# Altium project Servo-Board-v1.0.PrjPcb (part 18 of 23)

## Sheet Sec_Controller_Sheet2.SchDoc
size 420 x 297 mm; SheetNumber: 13; SheetTotal: 26
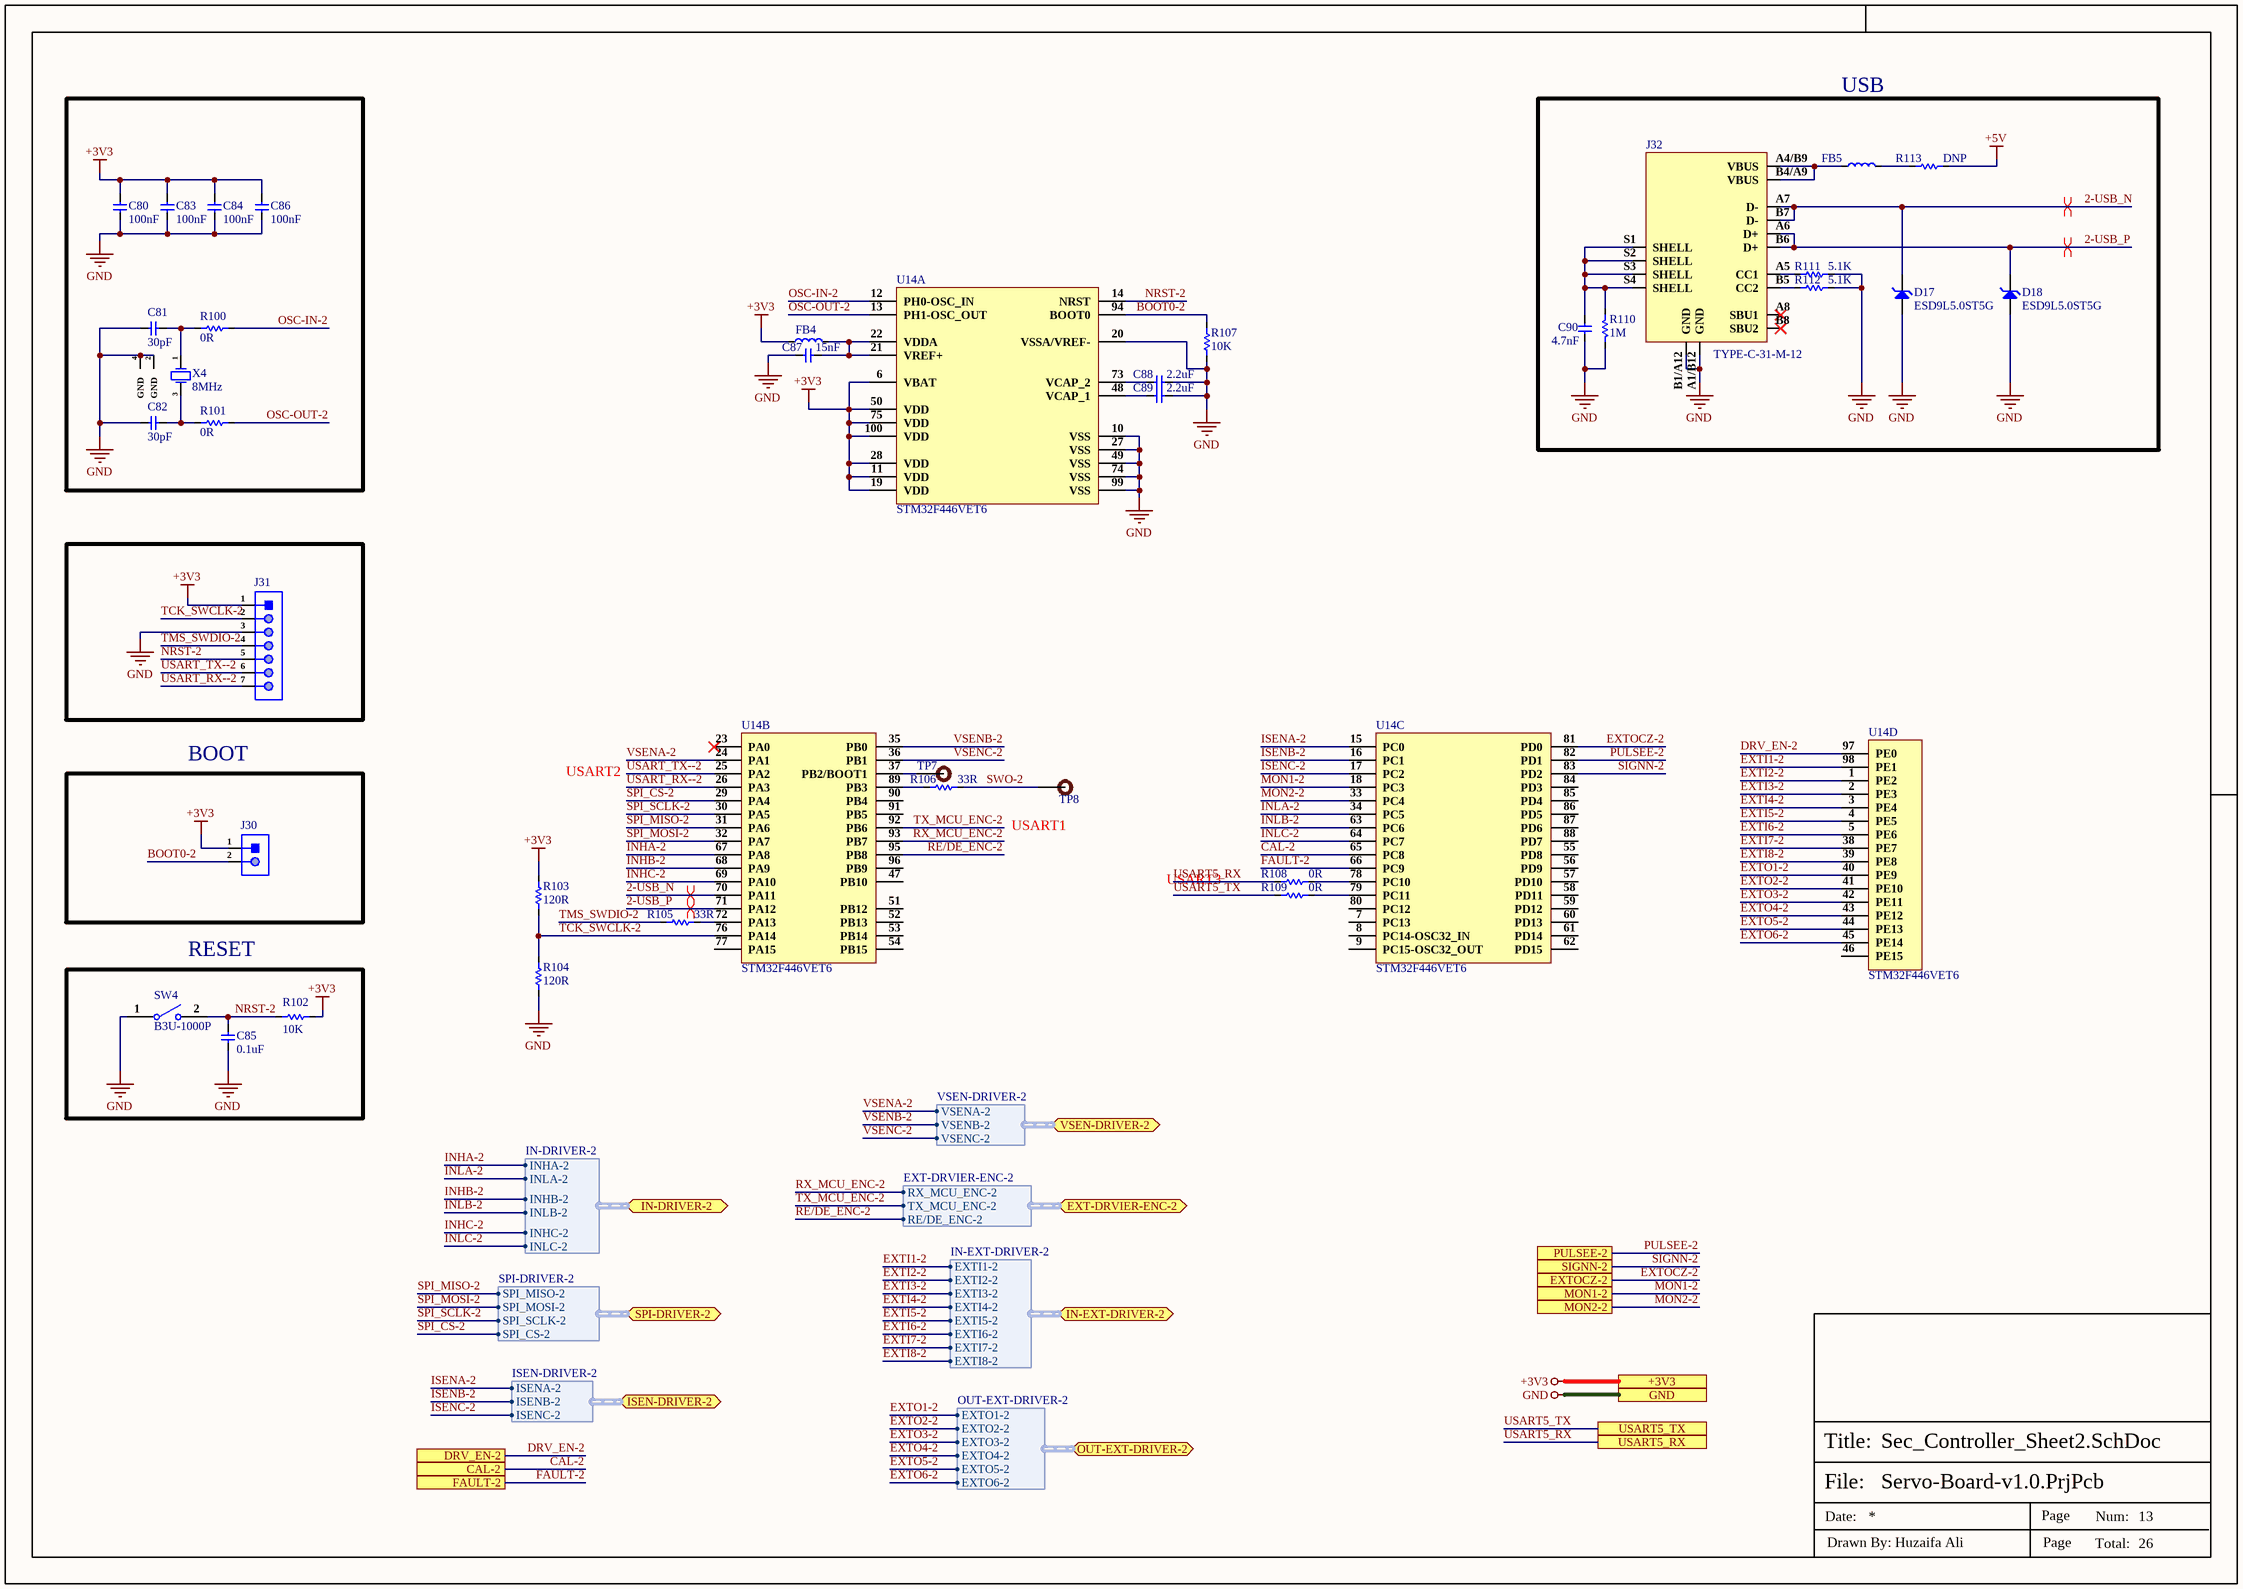
[diagram p22: Sec_Controller_Sheet2.SchDoc]

### Parts
C80  100nF  [cap-0402]
C81  30pF  [Cap-0402]
C82  30pF  [Cap-0402]
C83  100nF  [cap-0402]
C84  100nF  [cap-0402]
C85  0.1uF  [Cap-0402]
C86  100nF  [cap-0402]
C87  15nF  [Cap-0402]
C88  2.2uF  [Cap-0402]
C89  2.2uF  [Cap-0402]
C90  4.7nF  [Cap-0603]
D17  ESD9L5.0ST5G  [SOD-923.]
D18  ESD9L5.0ST5G  [SOD-923.]
FB4  BLM18PG221SN1D  [IND-0603 (1608 Metric)]  (value not drawn)
FB5  BLM18PG221SN1D  [IND-0603 (1608 Metric)]  (value not drawn)
J30  X6511WV-02H-C60D30  [HDR1X2_]  (value not drawn)
J31  X6511WV-07H-C60D30  [HDR1X7]  (value not drawn)
J32  TYPE-C-31-M-12  [TYPE-C-31-M-12_]
R100  0R  [Res-0603]
R101  0R  [Res-0603]
R102  10K  [Res-0402]
R103  120R  [Res-0402]
R104  120R  [Res-0402]
R105  33R  [Res-0402]
R106  33R  [Res-0402]
R107  10K  [Res-0402]
R108  0R  [Res-0402]
R109  0R  [Res-0402]
R110  1M  [Res-0402]
R111  5.1K  [Res-0402]
R112  5.1K  [Res-0402]
R113  DNP  [Res-0402]
SW4  B3U-1000P  [B3U-1000P]
TP7  TEST POINT 0.5mm Dia  [Test-point - 0.5mm]  (value not drawn)  (no BOM)
TP8  TEST POINT 0.5mm Dia  [Test-point - 0.5mm]  (value not drawn)  (no BOM)
U14  STM32F446VET6  [LQFP-100]  (parts A,B,C,D of 4)
X4  8MHz  [5TJ480000XYLBC_]

### Blocks framed on the sheet
USB: C90 D17 D18 FB5 J32 R110-R113
BOOT: J30
RESET: C85 R102 SW4

### Ports
+3V3 (see Servo2[3A], CAN_Sheet[4D], Controller_Sheet[5D], DIO_1[5D], DIO_2[5D], DIO_3[5D], DIO_4[5D], Encoder_Sheet1[5D], Encoder_Sheet2[4D], Encoder_Sheet3[4D], Encoder_Sheet4[5D], EtherCAT_Sheet[5D], Motor_Driver_Sheet1[5D], Motor_Driver_Sheet2[5D], Motor_Driver_Sheet3[5D], Motor_Driver_Sheet4[5D], Power_Sheet[5D], RS485_RS232_Sheet[5D], Sec_Controller_Sheet1[5D], Sec_Controller_Sheet3[5D], Sec_Controller_Sheet4[5D], Servo1[5D], Servo2[5D], Servo3[5D], Servo4[5D]), CAL-2 (see Servo2[3A], Motor_Driver_Sheet2[1D]), DRV_EN-2 (see Servo2[3A], Motor_Driver_Sheet2[1D]), EXT-DRVIER-ENC-2 (bidir, harness EXT-DRVIER-ENC-2, see Servo2[4B], Encoder_Sheet2[3D]), EXTOCZ-2 (see Servo2[4B], DIO_2[3D]), FAULT-2 (see Servo2[3B], Motor_Driver_Sheet2[1D]), GND (see Servo2[3A], CAN_Sheet[4D], Controller_Sheet[5D], DIO_1[5D], DIO_2[5D], DIO_3[5D], DIO_4[5D], Encoder_Sheet1[5D], Encoder_Sheet2[4D], Encoder_Sheet3[4D], Encoder_Sheet4[5D], EtherCAT_Sheet[5D], Motor_Driver_Sheet1[5D], Motor_Driver_Sheet2[5D], Motor_Driver_Sheet3[5D], Motor_Driver_Sheet4[5D], Power_Sheet[5D], RS485_RS232_Sheet[5D], Sec_Controller_Sheet1[5D], Sec_Controller_Sheet3[5D], Sec_Controller_Sheet4[5D], Servo1[5D], Servo2[5D], Servo3[5D], Servo4[5D]), IN-DRIVER-2 (bidir, harness IN-DRIVER-2, see Servo2[3B], Motor_Driver_Sheet2[1D]), IN-EXT-DRIVER-2 (bidir, harness IN-EXT-DRIVER-2, see Servo2[4B], DIO_2[1D]), ISEN-DRIVER-2 (bidir, harness ISEN-DRIVER-2, see Servo2[3B], Motor_Driver_Sheet2[3D]), MON1-2 (see Servo2[4B], DIO_2[3D]), MON2-2 (see Servo2[4B], DIO_2[3D]), OUT-EXT-DRIVER-2 (bidir, harness OUT-EXT-DRIVER-2, see Servo2[4B], DIO_2[2D]), PULSEE-2 (see Servo2[4B], DIO_2[3D]), SIGNN-2 (see Servo2[4B], DIO_2[3D]), SPI-DRIVER-2 (bidir, harness SPI-DRIVER-2, see Servo2[3B], Motor_Driver_Sheet2[2D]), USART5_RX (see Servo2[3B], Controller_Sheet[4D], Servo2[3B]), USART5_TX (see Servo2[3B], Controller_Sheet[4D], Servo2[3B]), VSEN-DRIVER-2 (bidir, harness VSEN-DRIVER-2, see Servo2[3B], Motor_Driver_Sheet2[4D])

### Harnesses
IN-DRIVER-2: INHA-2, INLA-2, INHB-2, INLB-2, INHC-2, INLC-2
SPI-DRIVER-2: SPI_MISO-2, SPI_MOSI-2, SPI_SCLK-2, SPI_CS-2
ISEN-DRIVER-2: ISENA-2, ISENB-2, ISENC-2
EXT-DRVIER-ENC-2: RX_MCU_ENC-2, TX_MCU_ENC-2, RE/DE_ENC-2
IN-EXT-DRIVER-2: EXTI1-2, EXTI2-2, EXTI3-2, EXTI4-2, EXTI5-2, EXTI6-2, EXTI7-2, EXTI8-2
OUT-EXT-DRIVER-2: EXTO1-2, EXTO2-2, EXTO3-2, EXTO4-2, EXTO5-2, EXTO6-2
VSEN-DRIVER-2: VSENA-2, VSENB-2, VSENC-2

### Nets
+3V3: C80.2 C83.2 C84.2 C86.2 FB4.1 J30.1 J31.1 R102.2 R103.2 U14.6(VBAT) U14.11(VDD) U14.19(VDD) U14.28(VDD) U14.50(VDD) U14.75(VDD) U14.100(VDD) ; port +3V3
+5V: R113.2
GND: C80.1 C81.1 C82.1 C83.1 C84.1 C85.1 C86.1 C87.1 C88.2 C89.2 C90.1 D17.2(A) D18.2(A) J31.3 J32.A1/B12(GND) J32.B1/A12(GND) R104.1 R107.1 R110.2 R111.2 R112.2 SW4.1 U14.10(VSS) U14.20(VSSA/VREF-) U14.27(VSS) U14.49(VSS) U14.74(VSS) U14.99(VSS) X4.2(GND) X4.4(GND) ; port GND
2-USB_N: D17.1(K) J32.A7(D-) J32.B7(D-) U14.70(PA11)
2-USB_P: D18.1(K) J32.A6(D+) J32.B6(D+) U14.71(PA12)
BOOT0-2: J30.2 R107.2 U14.94(BOOT0)
CAL-2: U14.65(PC8) ; port CAL-2
DRV_EN-2: U14.97(PE0) ; port DRV_EN-2
EXTI1-2: U14.98(PE1) ; port IN-EXT-DRIVER-2.EXTI1-2
EXTI2-2: U14.1(PE2) ; port IN-EXT-DRIVER-2.EXTI2-2
EXTI3-2: U14.2(PE3) ; port IN-EXT-DRIVER-2.EXTI3-2
EXTI4-2: U14.3(PE4) ; port IN-EXT-DRIVER-2.EXTI4-2
EXTI5-2: U14.4(PE5) ; port IN-EXT-DRIVER-2.EXTI5-2
EXTI6-2: U14.5(PE6) ; port IN-EXT-DRIVER-2.EXTI6-2
EXTI7-2: U14.38(PE7) ; port IN-EXT-DRIVER-2.EXTI7-2
EXTI8-2: U14.39(PE8) ; port IN-EXT-DRIVER-2.EXTI8-2
EXTO1-2: U14.40(PE9) ; port OUT-EXT-DRIVER-2.EXTO1-2
EXTO2-2: U14.41(PE10) ; port OUT-EXT-DRIVER-2.EXTO2-2
EXTO3-2: U14.42(PE11) ; port OUT-EXT-DRIVER-2.EXTO3-2
EXTO4-2: U14.43(PE12) ; port OUT-EXT-DRIVER-2.EXTO4-2
EXTO5-2: U14.44(PE13) ; port OUT-EXT-DRIVER-2.EXTO5-2
EXTO6-2: U14.45(PE14) ; port OUT-EXT-DRIVER-2.EXTO6-2
EXTOCZ-2: U14.81(PD0) ; port EXTOCZ-2
FAULT-2: U14.66(PC9) ; port FAULT-2
INHA-2: U14.67(PA8) ; port IN-DRIVER-2.INHA-2
INHB-2: U14.68(PA9) ; port IN-DRIVER-2.INHB-2
INHC-2: U14.69(PA10) ; port IN-DRIVER-2.INHC-2
INLA-2: U14.34(PC5) ; port IN-DRIVER-2.INLA-2
INLB-2: U14.63(PC6) ; port IN-DRIVER-2.INLB-2
INLC-2: U14.64(PC7) ; port IN-DRIVER-2.INLC-2
ISENA-2: U14.15(PC0) ; port ISEN-DRIVER-2.ISENA-2
ISENB-2: U14.16(PC1) ; port ISEN-DRIVER-2.ISENB-2
ISENC-2: U14.17(PC2) ; port ISEN-DRIVER-2.ISENC-2
MON1-2: U14.18(PC3) ; port MON1-2
MON2-2: U14.33(PC4) ; port MON2-2
NRST-2: C85.2 J31.5 R102.1 SW4.2 U14.14(NRST)
OSC-IN-2: R100.2 U14.12(PH0-OSC_IN)
OSC-OUT-2: R101.2 U14.13(PH1-OSC_OUT)
PULSEE-2: U14.82(PD1) ; port PULSEE-2
RE/DE_ENC-2: U14.95(PB8) ; port EXT-DRVIER-ENC-2.RE/DE_ENC-2
RX_MCU_ENC-2: U14.93(PB7) ; port EXT-DRVIER-ENC-2.RX_MCU_ENC-2
SIGNN-2: U14.83(PD2) ; port SIGNN-2
SPI_CS-2: U14.29(PA4) ; port SPI-DRIVER-2.SPI_CS-2
SPI_MISO-2: U14.31(PA6) ; port SPI-DRIVER-2.SPI_MISO-2
SPI_MOSI-2: U14.32(PA7) ; port SPI-DRIVER-2.SPI_MOSI-2
SPI_SCLK-2: U14.30(PA5) ; port SPI-DRIVER-2.SPI_SCLK-2
SWO-2: R106.2 TP8.1
TCK_SWCLK-2: J31.2 R103.1 R104.2 U14.76(PA14)
TMS_SWDIO-2: J31.4 R105.1
TX_MCU_ENC-2: U14.92(PB6) ; port EXT-DRVIER-ENC-2.TX_MCU_ENC-2
USART5_RX: R108.1 ; port USART5_RX
USART5_TX: R109.1 ; port USART5_TX
USART_RX--2: J31.7 U14.26(PA3)
USART_TX--2: J31.6 U14.25(PA2)
VSENA-2: U14.24(PA1) ; port VSEN-DRIVER-2.VSENA-2
VSENB-2: U14.35(PB0) ; port VSEN-DRIVER-2.VSENB-2
VSENC-2: U14.36(PB1) ; port VSEN-DRIVER-2.VSENC-2
NetC81_2: C81.2 R100.1 X4.1(OSC1)
NetC82_2: C82.2 R101.1 X4.3(OSC2)
NetC87_2: C87.2 FB4.2 U14.21(VREF+) U14.22(VDDA)
NetC88_1: C88.1 U14.73(VCAP_2)
NetC89_1: C89.1 U14.48(VCAP_1)
NetC90_2: C90.2 J32.S1(SHELL) J32.S2(SHELL) J32.S3(SHELL) J32.S4(SHELL) R110.1
NetFB5_1: FB5.1 J32.A4/B9(VBUS) J32.B4/A9(VBUS)
NetFB5_2: FB5.2 R113.1
NetJ32_A5: J32.A5(CC1) R111.1
NetJ32_B5: J32.B5(CC2) R112.1
NetR105_2: R105.2 U14.72(PA13)
NetR106_1: R106.1 U14.89(PB3)
NetR108_2: R108.2 U14.78(PC10)
NetR109_2: R109.2 U14.79(PC11)
NetTP7_1: TP7.1 U14.37(PB2/BOOT1)

Not connected (* = marked no-connect by the designer): J32 A8(SBU1)* B8(SBU2)*; U14 7(PC13) 8(PC14-OSC32_IN) 9(PC15-OSC32_OUT) 23(PA0)* 46(PE15) 47(PB10) 51(PB12) 52(PB13) 53(PB14) 54(PB15) 55(PD8) 56(PD9) 57(PD10) 58(PD11) 59(PD12) 60(PD13) 61(PD14) 62(PD15) 77(PA15) 80(PC12) 84(PD3) 85(PD4) 86(PD5) 87(PD6) 88(PD7) 90(PB4) 91(PB5) 96(PB9)

### Layout directives
differential pair; net class USB_PROGRAM; differential pair class USB_PROGRAM_LINES; rule Impedance Constraint [Min = 85.00    Max = 90.00    ]; rule Matched Net Lengths [Tolerance = 50mil]: 2-USB_N, 2-USB_P

### Notes on the sheet
- USART2
- (near TP8) USART1
- USART3
- File:
- Title:
- Date:
- Page
- Num:
- Total:
- Drawn By: Huzaifa Ali

### Library data of the parts
C80 C83 C84 C86 = C1005X7R1H104KT000F: CAP CER 0.1UF 50V X7R 0402; Manufacturer: TDK; Tolerance: 10%; Voltage: 25V; Item Type: Capacitor; Supplier 1: Avnet; Manufacturer Part Number: C1005X7R1H104KT000F; RoHS: No; Category: Ceramic Capacitors; Dielectric: X7R; Supplier Part Number 1: C1005X7R1H104KT000F; LCSC Part Number: C361198; ComponentLink1Description: LCSC; ComponentLink1URL: https://www.lcsc.com/product-detail/Multilayer-Ceramic-Capacitors-MLCC-SMD-SMT_TDK-C1005X7R1H104KT000F_C361198.html
C81 C82 = CC0402GRNPO9BN300: CAP CER 30PF 50V C0G/NPO 0402; Manufacturer: Yageo; Item Type: Capacitor; Tolerance: 2%; Dielectric: C0G; Supplier: Digikey; LCSC Part Number: C277479; Manufacturer Part Number: CC0402GRNPO9BN300; RoHS: Yes; Stock: 114930; Pricing: 1=0.1, 10=0.052, 50=0.0296, 100=0.023, 500=0.01728, 1000=0.01358, 2500=0.01235, 5000=0.01136 (USD); Mounting Technology: Surface Mount; Case/Package: 0402; Case Code (Imperial): 0402; Case Code (Metric): 1005; Weight: 2.3E-05oz; Min Operating Temperature: -55°C; Max Operating Temperature: 125°C; Value: 30pF; Voltage Rating (DC): 50V; Packaging: Tape and Reel; Termination: SMD/SMT; Voltage Rating: 50V; Series: CC; Length: 0.039inch; Width: 0.02inch; Thickness: 0.022inch; Halogen Free: 5694HalogenFree; Lead Free: 5697LeadFree; ComponentLink1URL: https://datasheet.ciiva.com/13263/upy-gp-np0-16v-to-50v-8-3714-13263350.pdf?src-supplier=Mouser; ComponentLink1Description: https://datasheet.ciiva.com/13263/upy-gp-np0-16v-to-50v-8-3714-13263350.pdf?src-supplier=Mouser
C85 = CC0402JRX7R7BB104: CAP CER 0.1UF 16V X7R 0402; Manufacturer: Yageo; Material: 4241ConductorMaterial; Value: 100nF; Tolerance: 5%; Item Type: Capacitor; Supplier: Digikey; Supplier Part Number: 311-1676-1-ND; Manufacturer Part Number: CC0402JRX7R7BB104; RoHS: Yes; Category: Ceramic Capacitors; Stock: 1659111; Pricing: 1=0.1, 10=0.046, 50=0.0262, 100=0.0203, 500=0.01528, 1000=0.012, 2500=0.01091, 5000=0.01004 (USD); Mounting Technology: Surface Mount; Case/Package: 0402; Case Code (Metric): 1005; Case Code (Imperial): 0402; Min Operating Temperature: -55°C; Max Operating Temperature: 125°C; Dielectric: X7R; Packaging: Tape and Reel; Package Quantity: 10000; Voltage Rating (DC): 16V; Voltage Rating: 16V; Series: CC; Construction: Flat; Length: 0.039inch; Width: 0.02inch; Height: 0.5mm; Thickness: 0.022inch; Lead Free: Lead Free; Halogen Free: Halogen Free; RoHS Compliant: Yes; ComponentLink1URL: https://datasheet.ciiva.com/13210/upy-gphc-x7r-6-3v-to-50v-8-12304-13210152.pdf?src-supplier=Mouser; ComponentLink1Description: https://datasheet.ciiva.com/13210/upy-gphc-x7r-6-3v-to-50v-8-12304-13210152.pdf?src-supplier=Mouser; LCSC Part Number: C541464
C87 = CC0402JRX7R7BB153: CAP CER 0.015UF 16V X7R 0402; Manufacturer: Yageo; Tolerance: 5%; Item Type: Capacitor; Supplier: Digikey; Supplier Part Number: 13-CC0402JRX7R7BB153CT-ND; Manufacturer Part Number: CC0402JRX7R7BB153; RoHS: Yes; Category: Ceramic Capacitors; Stock: 24539; Pricing: 1=0.1, 10=0.045, 50=0.0258, 100=0.0201, 500=0.0151, 1000=0.01186, 2500=0.01078, 5000=0.00992 (USD); Mounting Technology: Surface Mount; Case/Package: 0402; Case Code (Imperial): 0402; Case Code (Metric): 1005; Weight: 2.3E-05oz; Min Operating Temperature: -55°C; Max Operating Temperature: 125°C; Value: 15nF; Voltage Rating (DC): 16V; Packaging: Tape and Reel; Dielectric: X7R; Voltage Rating: 16V; Termination: SMD/SMT; Series: CC; Length: 0.039inch; Width: 0.02inch; Thickness: 0.022inch; Lead Free: Lead Free; Halogen Free: Halogen Free; RoHS Compliant: Yes; ComponentLink1URL: https://datasheet.ciiva.com/13263/upy-gphc-x7r-6-3v-to-50v-8-12304-13263342.pdf?src-supplier=Mouser; ComponentLink1Description: https://datasheet.ciiva.com/13263/upy-gphc-x7r-6-3v-to-50v-8-12304-13263342.pdf?src-supplier=Mouser; LCSC Part Number: C527002
C88 C89 = C1005X5R0J225KTJA0E: CAP CER 2.2UF 6.3V X5R 0402; Manufacturer: TDK; Item Type: Capacitor; LCSC Part Number: C343036; Manufacturer Part Number: C1005X5R0J225KTJA0E; ComponentLink1Description: LCSC; ComponentLink1URL: https://www.lcsc.com/product-detail/Multilayer-Ceramic-Capacitors-MLCC-SMD-SMT_TDK-C1005X5R0J225KTJA0E_C343036.html
C90 = CC0603JRNPO9BN472: CAP CER 4700PF 50V C0G/NPO 0603; Manufacturer: Yageo; Item Type: Capacitor; Supplier 1: Digi-Key; Manufacturer Part Number: CC0603JRNPO9BN472; RoHS: Yes; Category: Ceramic Capacitors; Stock 1: 31779; Pricing 1: 1=0.48000, 10=0.33000, 50=0.23100, 100=0.19800, 500=0.14854, 1000=0.12543 (USD); RoHS Compliant: Yes; Supplier Part Number 1: 13-CC0603JRNPO9BN472CT-ND; LCSC Part Number: C576818; ComponentLink1Description: LCSC; ComponentLink1URL: https://www.lcsc.com/product-detail/Multilayer-Ceramic-Capacitors-MLCC-SMD-SMT_YAGEO-CC0603JRNPO9BN472_C576818.html
D17 D18 = ESD9L5.0ST5G: TVS DIODE 5V 9.8V SOD923; Manufacturer: ON Semiconductor; Capacitance: 0.9pF; Direction: Unidirectional; Number of Unidirectional Channels: 1; Min Breakdown Voltage: 5.4V; Power Line Protection: No; Leakage Current: 1uA; Element Configuration: Single; Peak Pulse Current: 1A; Diode Type: ZENER; Reverse Breakdown Voltage: 5.8V; Peak Pulse Power: 150mW; ESD Protection: Yes; Test Current: 1mA; Supplier 1: Digi-Key; Manufacturer Part Number: ESD9L5.0ST5G; RoHS: Yes; Category: ESD and Circuit Protection ICs; Stock 1: 558996; Pricing 1: 1=0.37000, 10=0.25600, 100=0.12500, 500=0.10426, 1000=0.07244, 2000=0.06278 (USD); Case/Package: SOD-923-2; Number of Pins: 2; Contact Plating: Tin,Matte; Min Operating Temperature: -55°C; Max Operating Temperature: 150°C; Package Quantity: 1; Packaging: Tape and Reel; Clamping Voltage: 9.8V; Reverse Standoff Voltage: 5V; Working Voltage: 5V; Resistor Type: Zener; Series: Automotive, AEC-Q101; Number of Elements: 1; Operating Supply Voltage: 5V; Max Surge Current: 1A; Breakdown Voltage: 5.4V; Number of Channels: 1; Polarity: Unidirectional; Termination: SMD/SMT; Max Reverse Leakage Current: 1uA; Max Breakdown Voltage: 5.4V; Number of Lines: 1; Power Dissipation: 150mW; Clamping Voltage-Max: 9.8V; Length: 0.8mm; Width: 0.65mm; Height: 0.4mm; Depth: 0.6mm; Radiation Hardening: No; Lead Free: Lead Free; RoHS Compliant: Yes; REACH SVHC: No SVHC; Halogen Free: Halogen Free; ComponentLink1URL: https://datasheet.ciiva.com/15143/getdatasheetpartid-185186-15143896.pdf?src-supplier=Verical; ComponentLink1Description: https://datasheet.ciiva.com/15143/getdatasheetpartid-185186-15143896.pdf?src-supplier=Verical; ComponentLink2URL: https://datasheet.ciiva.com/4510/esd9l-d-4510647.pdf?src-supplier=Mouser; ComponentLink2Description: https://datasheet.ciiva.com/4510/esd9l-d-4510647.pdf?src-supplier=Mouser; ComponentLink3URL: https://datasheet.ciiva.com/3304/esd9l-d-3304011.pdf?src-supplier=Avnet; ComponentLink3Description: https://datasheet.ciiva.com/3304/esd9l-d-3304011.pdf?src-supplier=Avnet; ComponentLink4URL: https://datasheet.ciiva.com/16437/esd9l-d-16437835.pdf?src-supplier=Future+Electronics; ComponentLink4Description: https://datasheet.ciiva.com/16437/esd9l-d-16437835.pdf?src-supplier=Future+Electronics; ComponentLink5URL: https://datasheet.ciiva.com/339/esd9l-d-339853.pdf?src-supplier=Digi-Key; ComponentLink5Description: https://datasheet.ciiva.com/339/esd9l-d-339853.pdf?src-supplier=Digi-Key; ComponentLink6URL: https://datasheet.ciiva.com/339/esd9l-d-339854.pdf?src-supplier=Digi-Key; ComponentLink6Description: https://datasheet.ciiva.com/339/esd9l-d-339854.pdf?src-supplier=Digi-Key; ComponentLink7URL: https://datasheet.ciiva.com/11195/esd9l-d-11195342.pdf?src-supplier=Avnet; ComponentLink7Description: https://datasheet.ciiva.com/11195/esd9l-d-11195342.pdf?src-supplier=Avnet; ComponentLink8URL: https://datasheet.ciiva.com/25958/esd9l-d-25958446.pdf?src-supplier=Avnet+Europe; ComponentLink8Description: https://datasheet.ciiva.com/25958/esd9l-d-25958446.pdf?src-supplier=Avnet+Europe; ComponentLink9URL: https://datasheet.ciiva.com/339/esd9l-d-339855.pdf?src-supplier=Digi-Key; ComponentLink9Description: https://datasheet.ciiva.com/339/esd9l-d-339855.pdf?src-supplier=Digi-Key; Supplier Part Number 1: ESD9L5.0ST5GOSCT-ND; LCSC Part Number: C82326
FB4 FB5 = BLM18PG221SN1D: FERRITE BEAD 220 OHM 0603 1LN; Manufacturer: Murata; Manufacturer Series: BLM18P; Material: Steel,Ferrite; Value: 100mR; Impedance: 220R; Tolerance: 25%; Current Rating: 1.4A; Number of Lines: 1; Test Frequency: 100MHz; Shielding: Unshielded; Supplier: Digikey; LCSC Part Number: C80165; Manufacturer Part Number: BLM18PG221SN1D; RoHS: Yes; Item Type: Ferrite Bead; Stock: 134052; Pricing: 1=0.1, 10=0.078, 25=0.0712, 50=0.064, 100=0.0469, 250=0.03412, 500=0.03128, 1000=0.02701 (USD); Case/Package: 0603; Pins: 2; Core Material: Ferrite; Case Code (Metric): 1608; Case Code (Imperial): 0603; Weight: 7.1E-05oz; Min Operating Temperature: -55°C; Max Operating Temperature: 125°C; Package Quantity: 1; Packaging: Tape and Reel; ESR (Equivalent Series Resistance): 220R; Max Current Rating: 1.4A; DC Resistance (DCR): 100mR; Termination: SMD/SMT; Max DC Current: 1.4A; DC Current: 1.4A; Number of Circuits: 1; Series: BLM18P; Channels: 1; DC Resistance-Max: 100mR; RMS Current (Irms): 1.4A; ESR: 100mR; Length: 1.6mm; Width: 0.8mm; Height: 0.8mm; Depth: 0.8mm; Radiation Hardening: No; Reach SVHC Compliant: No; Lead Free: Lead Free; RoHS Compliant: Yes; ComponentLink1URL: https://datasheet.ciiva.com/19458/1845030-19458417.pdf?src-supplier=Jameco; ComponentLink1Description: https://datasheet.ciiva.com/19458/1845030-19458417.pdf?src-supplier=Jameco; ComponentLink2URL: https://datasheet.ciiva.com/11800/0900766b81275ca5-11800851.pdf?src-supplier=Rs; ComponentLink2Description: https://datasheet.ciiva.com/11800/0900766b81275ca5-11800851.pdf?src-supplier=Rs; ComponentLink3URL: https://datasheet.ciiva.com/29347/442391-da-01-en-chip-drossel-0603-220r-1400ma-1-6x0-8mm-29347986.pdf?src-supplier=Conrad; ComponentLink3Description: https://datasheet.ciiva.com/29347/442391-da-01-en-chip-drossel-0603-220r-1400ma-1-6x0-8mm-29347986.pdf?src-supplier=Conrad; ComponentLink4URL: https://datasheet.ciiva.com/8021/5148-8021482.pdf?src-supplier=Element14; ComponentLink4Description: https://datasheet.ciiva.com/8021/5148-8021482.pdf?src-supplier=Element14; ComponentLink5URL: https://datasheet.ciiva.com/8021/5148-8021479.pdf?src-supplier=Element14; ComponentLink5Description: https://datasheet.ciiva.com/8021/5148-8021479.pdf?src-supplier=Element14; ComponentLink6URL: https://datasheet.ciiva.com/14122/blm-series-eng-tds-14122909.pdf?src-supplier=Distrelec; ComponentLink6Description: https://datasheet.ciiva.com/14122/blm-series-eng-tds-14122909.pdf?src-supplier=Distrelec; ComponentLink7URL: https://datasheet.ciiva.com/1012/l0110s0100blm18p-1012162.pdf?src-supplier=Digikey; ComponentLink7Description: https://datasheet.ciiva.com/1012/l0110s0100blm18p-1012162.pdf?src-supplier=Digikey; ComponentLink8URL: https://datasheet.ciiva.com/1012/l0110s0100blm18p-1012161.pdf?src-supplier=Digikey; ComponentLink8Description: https://datasheet.ciiva.com/1012/l0110s0100blm18p-1012161.pdf?src-supplier=Digikey; ComponentLink9URL: https://datasheet.ciiva.com/1012/l0110s0100blm18p-1012163.pdf?src-supplier=Digikey; ComponentLink9Description: https://datasheet.ciiva.com/1012/l0110s0100blm18p-1012163.pdf?src-supplier=Digikey; ComponentLink10URL: https://datasheet.ciiva.com/3081/l0110s0100blm18p-3081633.pdf?src-supplier=Avnet; ComponentLink10Description: https://datasheet.ciiva.com/3081/l0110s0100blm18p-3081633.pdf?src-supplier=Avnet; ComponentLink11URL: https://datasheet.ciiva.com/16205/l0110s0100blm18p-16205422.pdf?src-supplier=Future+Electronics; ComponentLink11Description: https://datasheet.ciiva.com/16205/l0110s0100blm18p-16205422.pdf?src-supplier=Future+Electronics
J30 = X6511WV-02H-C60D30: Gold 250V 3A Straight Square Pins 2.5mm 2P 260℃ 6mm -40℃~+105℃ 3mm 2.54mm Plugin Black Brass 1x2P Plugin,P=2.54mm Pin Headers ROHS; Manufacturer: XKB; Item Type: Male Header; Manufacturer Part Number: X6511WV-02H-C60D30; Package: Plugin,P=2.54mm; LCSC Part Number: C706874; ComponentLink1Description: LCSC; ComponentLink1URL: https://www.lcsc.com/product-detail/Pin-Headers_XKB-Connectivity-X6511WV-02H-C60D30_C706874.html
J31 = X6511WV-07H-C60D30: Gold 250V 3A Straight Square Pins 2.5mm 7P 260℃ 6mm -40℃~+105℃ 3mm 2.54mm Plugin Black Brass 1x7P Plugin,P=2.54mm Pin Headers ROHS; Manufacturer: XKB; Item Type: Male Header; Manufacturer Part Number: X6511WV-07H-C60D30; Package: Plugin,P=2.54mm; LCSC Part Number: C706879; ComponentLink1Description: LCSC; ComponentLink1URL: https://www.lcsc.com/product-detail/Pin-Headers_XKB-Connectivity-X6511WV-07H-C60D30_C706879.html
J32 = TYPE-C-31-M-12: 5A 1 16P Female Type-C SMD USB Connectors ROHS; Manufacturer: Korean Hroparts Elec; ComponentLink1Description: LCSC; ComponentLink1URL: https://www.lcsc.com/product-detail/USB-Connectors_Korean-Hroparts-Elec-TYPE-C-31-M-12_C165948.html; Manufacturer Part Number: TYPE-C-31-M-12; Footprint: Custom; LCSC Part Number: C165948; Item Type: USB Connector
R100 R101 = RC0603JR-070RL: RES 0 OHM JUMPER 1/10W 0603; Manufacturer: Yageo; Resistance: 0mR; Tolerance: 1%; Power Rating: 100mW; Voltage Rating (DC): 50V; Temperature Coefficient: 200ppm/°C; Resistance Tolerance: 5%; Item Type: Resistor; Supplier 1: Digi-Key; Manufacturer Part Number: RC0603JR-070RL; RoHS: Yes; Category: Chip SMD Resistors; Stock 1: 18081776; Pricing 1: 1=0.10000, 10=0.01700, 25=0.01240, 50=0.00960, 100=0.00700, 250=0.00536, 500=0.00430, 1000=0.00316 (USD); Case/Package: 0603; Number of Pins: 2; Contact Plating: Tin,Matte; Case Code (Imperial): 0603; Case Code (Metric): 1608; Size Code: 0603; Min Operating Temperature: -55°C; Max Operating Temperature: 155°C; Resistor Type: Thick Film; Packaging: Tape and Reel; Termination: SMD/SMT; Series: RC; Technology: THICK FILM; Package Quantity: 5000; Voltage Rating: 50V; Features: Moisture Resistant; Max Power Dissipation: 100mW; Number of Terminations: 2; Construction: Rectangular; Length: 1.6mm; Width: 0.8mm; Height: 0.45mm; Depth: 0.8mm; Radiation Hardening: No; Reach SVHC Compliant: No SVHC; Lead Free: Lead Free; RoHS Compliant: Yes; Military Standard: Not; Supplier Part Number 1: 311-0.0GRCT-ND; LCSC Part Number: C95177
R102 R107 = RC0402FR-0710KL: RES 10K OHM 1% 1/16W 0402; Manufacturer: Yageo; Resistance: 10kR; Voltage Rating (DC): 50V; Temperature Coefficient: 100ppm/°C; Power Rating: 62.5mW; Max Power Dissipation: 63mW; Item Type: Resistor; Supplier 1: Mouser; Manufacturer Part Number: RC0402FR-0710KL; RoHS: Yes; Category: Chip SMD Resistors; Stock 1: 18648329; Pricing 1: 1=0.10000, 10=0.01400, 50=0.01400, 100=0.00500, 1000=0.00300, 10000=0.00200 (USD); Case/Package: 0402; Number of Pins: 2; Case Code (Imperial): 0402; Case Code (Metric): 1005; Min Operating Temperature: -55°C; Max Operating Temperature: 155°C; Resistor Type: Thick Film; Tolerance: 1%; Packaging: Tape and Reel; Voltage Rating: 50V; Termination: SMD/SMT; Working Voltage: 50V; Number of Terminations: 2; Features: Moisture Resistant; Series: RC; Resistance Tolerance: 1%; Construction: Rectangular; Length: 1mm; Width: 0.5mm; Height: 0.32mm; Depth: 0.5mm; Lead Pitch: 0.2mm; REACH SVHC: No SVHC; Lead Free: Lead Free; RoHS Compliant: Yes; Military Standard: Not; ComponentLink1URL: https://datasheet.ciiva.com/7660/38568-7660787.pdf?src-supplier=Element14; ComponentLink1Description: https://datasheet.ciiva.com/7660/38568-7660787.pdf?src-supplier=Element14; ComponentLink2URL: https://datasheet.ciiva.com/7849/1686128-7849814.pdf?src-supplier=Element14; ComponentLink2Description: https://datasheet.ciiva.com/7849/1686128-7849814.pdf?src-supplier=Element14; ComponentLink3URL: https://datasheet.ciiva.com/7983/1018594-7983486.pdf?src-supplier=Element14; ComponentLink3Description: https://datasheet.ciiva.com/7983/1018594-7983486.pdf?src-supplier=Element14; ComponentLink4URL: https://datasheet.ciiva.com/22747/1018594-22747512.pdf?src-supplier=Element14; ComponentLink4Description: https://datasheet.ciiva.com/22747/1018594-22747512.pdf?src-supplier=Element14; ComponentLink5URL: https://datasheet.ciiva.com/12667/pyu-rc0402-51-rohs-l-6-r-12667067.pdf?src-supplier=Mouser; ComponentLink5Description: https://datasheet.ciiva.com/12667/pyu-rc0402-51-rohs-l-6-r-12667067.pdf?src-supplier=Mouser; ComponentLink6URL: https://datasheet.ciiva.com/7849/1784430-7849813.pdf?src-supplier=Element14; ComponentLink6Description: https://datasheet.ciiva.com/7849/1784430-7849813.pdf?src-supplier=Element14; ComponentLink7URL: https://datasheet.ciiva.com/7849/1784430-7849815.pdf?src-supplier=Element14; ComponentLink7Description: https://datasheet.ciiva.com/7849/1784430-7849815.pdf?src-supplier=Element14; Supplier Part Number 1: 603-RC0402FR-0710KL; LCSC Part Number: C60490
R103 R104 = RC0402FR-07120RL: RES 120 OHM 1% 1/16W 0402; Manufacturer: Yageo; Item Type: Resistors; Power Rating: 62.5mW; Voltage Rating: 50V; Temperature Coefficient: 100ppm/°C; Max Power Dissipation: 63mW; Supplier: Future Electronics; Supplier Part Number: 4529079; Manufacturer Part Number: RC0402FR-07120RL; RoHS: Yes; Stock: 150000; Pricing: 10000=0.0012, 100000=0.0011, 300000=0.001, 750000=0.001, 2000000=0.0009 (USD); Case/Package: 0402; Case Code (Imperial): 0402; Case Code (Metric): 1005; Min Operating Temperature: -55°C; Max Operating Temperature: 155°C; Package Quantity: 1; Value: 120R; Tolerance: 1%; Packaging: Tape and Reel; Termination: SMD/SMT; Resistor Type: Thick Film; Number of Terminations: 2; Features: Moisture Resistant; Series: RC; Resistance Tolerance: 1%; Construction: Rectangular; Technology: THICK FILM; Voltage Rating (AC): 50V; Length: 0.039inch; Width: 0.02inch; Height: 0.016inch; Depth: 0.5mm; Reach SVHC Compliant: No; Military Standard: Not; RoHS Compliant: Yes; Lead Free: 5697LeadFree; ComponentLink1URL: https://datasheet.ciiva.com/12667/pyu-rc0402-51-rohs-l-6-r-12667958.pdf?src-supplier=Mouser; ComponentLink1Description: https://datasheet.ciiva.com/12667/pyu-rc0402-51-rohs-l-6-r-12667958.pdf?src-supplier=Mouser; ComponentLink2URL: https://datasheet.ciiva.com/7849/1018594-7849831.pdf?src-supplier=Element14; ComponentLink2Description: https://datasheet.ciiva.com/7849/1018594-7849831.pdf?src-supplier=Element14; LCSC Part Number: C114758
R105 R106 = RC0402FR-0733RL: RES 33 OHM 1% 1/16W 0402; Manufacturer: Yageo; Power Rating: 62.5mW; Voltage Rating: 50V; Temperature Coefficient: 100ppm/°C; Max Power Dissipation: 63mW; Supplier 1: Mouser; Manufacturer Part Number: RC0402FR-0733RL; RoHS: Yes; Category: Chip SMD Resistors; Stock 1: 1843488; Pricing 1: 1=0.10000, 10=0.01200, 50=0.01200, 100=0.00500, 1000=0.00300, 10000=0.00100 (USD); Case/Package: 0402; Number of Pins: 2; Case Code (Imperial): 0402; Case Code (Metric): 1005; Size Code: 0402; Min Operating Temperature: -55°C; Max Operating Temperature: 155°C; Resistor Type: Thick Film; Resistance: 33R; Tolerance: 1%; Packaging: Tape and Reel; Voltage Rating (DC): 50V; Package Quantity: 10000; Termination: SMD/SMT; Features: Moisture Resistant; Series: RC; Number of Terminations: 2; Resistance Tolerance: 1%; Construction: Rectangular; Technology: THICK FILM; Length: 1mm; Width: 0.5mm; Height: 0.35mm; Depth: 0.5mm; RoHS Compliant: Yes; REACH SVHC: Unknown; Military Standard: Not; Lead Free: Lead Free; ComponentLink1URL: https://datasheet.ciiva.com/11819/0900766b80c66297-11819487.pdf?src-supplier=RSComponents; ComponentLink1Description: https://datasheet.ciiva.com/11819/0900766b80c66297-11819487.pdf?src-supplier=RSComponents; ComponentLink2URL: https://datasheet.ciiva.com/24070/pyu-rc0402-51-rohs-l-6-r-8721-24070077.pdf?src-supplier=Mouser; ComponentLink2Description: https://datasheet.ciiva.com/24070/pyu-rc0402-51-rohs-l-6-r-8721-24070077.pdf?src-supplier=Mouser; ComponentLink3URL: https://datasheet.ciiva.com/7849/1018594-7849967.pdf?src-supplier=Element14; ComponentLink3Description: https://datasheet.ciiva.com/7849/1018594-7849967.pdf?src-supplier=Element14; ComponentLink4URL: https://datasheet.ciiva.com/7849/1018594-7849966.pdf?src-supplier=Element14; ComponentLink4Description: https://datasheet.ciiva.com/7849/1018594-7849966.pdf?src-supplier=Element14; ComponentLink5URL: https://datasheet.ciiva.com/15189/getdatasheetpartid-329253-15189431.pdf?src-supplier=Verical; ComponentLink5Description: https://datasheet.ciiva.com/15189/getdatasheetpartid-329253-15189431.pdf?src-supplier=Verical; ComponentLink6URL: https://datasheet.ciiva.com/17070/pyu-rc0402-51-rohs-l-6-r-17070335.pdf?src-supplier=Future+Electronics; ComponentLink6Description: https://datasheet.ciiva.com/17070/pyu-rc0402-51-rohs-l-6-r-17070335.pdf?src-supplier=Future+Electronics; Supplier Part Number 1: 603-RC0402FR-0733RL; LCSC Part Number: C138002
R108 R109 = RC0402FR-070RL: RES 0 OHM JUMPER 1/16W 0402; Manufacturer: Yageo; Item Type: Resistors; Tolerance: 1%; Power Rating: 62.5mW; Voltage Rating: 50V; Temperature Coefficient: 200ppm/°C; Max Power Dissipation: 63mW; Supplier 1: Mouser; Manufacturer Part Number: RC0402FR-070RL; RoHS: Yes; Stock 1: 8556842; Pricing 1: 1=0.10000, 10=0.01400, 50=0.01400, 100=0.00600, 1000=0.00300, 5000=0.00200, 10000=0.00100 (USD); Mount: Surface Mount; Case/Package: 0402; Contact Plating: Tin,Matte; Case Code (Imperial): 0402; Case Code (Metric): 1005; Size Code: 0402; Min Operating Temperature: -55°C; Max Operating Temperature: 155°C; Resistance: 0R; Resistor Type: Thick Film; Packaging: Tape and Reel; Termination: SMD/SMT; Features: Moisture Resistant; Series: RC; Number of Terminations: 2; Length: 1mm; Width: 0.5mm; Height: 0.35mm; Radiation Hardening: No; Lead Free: Lead Free; RoHS Compliant: Yes; ComponentLink1URL: https://datasheet.ciiva.com/8896/pyu-rc0402-51-rohs-l-6-8896149.pdf?src-supplier=Avnet; ComponentLink1Description: https://datasheet.ciiva.com/8896/pyu-rc0402-51-rohs-l-6-8896149.pdf?src-supplier=Avnet; ComponentLink2URL: https://datasheet.ciiva.com/16790/pyu-rc0402-51-rohs-l-6-r-16790444.pdf?src-supplier=Future+Electronics; ComponentLink2Description: https://datasheet.ciiva.com/16790/pyu-rc0402-51-rohs-l-6-r-16790444.pdf?src-supplier=Future+Electronics; Supplier Part Number 1: 603-RC0402FR-070RL; LCSC Part Number: C106231
R110 = AF0402JR-071ML: RES SMD 1M OHM 5% 1/16W 0402; Manufacturer: Yageo; Resistance: 1MR; Max Power Dissipation: 63mW; Temperature Coefficient: 100ppm/°C; Item Type: Resistor; Supplier 1: Digi-Key; Manufacturer Part Number: AF0402JR-071ML; Stock 1: 0; Pricing 1: 10000=0.00408 (USD); Case/Package: 0402; Min Operating Temperature: -55°C; Max Operating Temperature: 155°C; Packaging: Tape and Reel; Resistor Type: Thick Film; Number of Terminations: 2; Tolerance: 5%; Features: Moisture Resistant,Anti-Sulfur; Length: 0.039inch; Width: 0.02inch; Height: 0.015inch; RoHS Compliant: Yes; ComponentLink1URL: https://www.yageo.com/upload/media/product/productsearch/datasheet/rchip/PYu-AF_51_RoHS_L_6.pdf?src-supplier=Digi-Key; ComponentLink1Description: https://www.yageo.com/upload/media/product/productsearch/datasheet/rchip/PYu-AF_51_RoHS_L_6.pdf?src-supplier=Digi-Key; Supplier Part Number 1: AF0402JR-071ML-ND; LCSC Part Number: C144054
R111 R112 = RC0402FR-075K1L: RES 5.1K OHM 1% 1/16W 0402; Manufacturer: Yageo; Power Rating: 63mW; Resistance: 5.1kR; Temperature Coefficient: 100ppm/°C; Voltage Rating: 50V; Item Type: Resistor; Supplier 1: Avnet; Manufacturer Part Number: RC0402FR-075K1L; RoHS: Yes; Category: Chip SMD Resistors; Stock 1: 65000; Pricing 1: 10000=0.00085 (USD); Case/Package: 0402; Case Code (Metric): 1005; Case Code (Imperial): 0402; Min Operating Temperature: -55°C; Max Operating Temperature: 155°C; Tolerance: 1%; Technology: THICK FILM; Packaging: Tape and Reel; Package Quantity: 1; Resistor Type: Thick Film; Number of Terminations: 2; Termination: SMD/SMT; Max Power Dissipation: 63mW; Voltage Rating (DC): 50V; Working Voltage: 50V; Features: Moisture Resistant; Series: RC; Resistance Tolerance: 1%; Construction: Rectangular; Length: 1mm; Width: 0.02inch; Height: 0.016inch; Depth: 0.5mm; RoHS Compliant: Yes; Military Standard: Not; Lead Free: Lead Free; ComponentLink1URL: https://datasheet.ciiva.com/7983/1018594-7983519.pdf?src-supplier=Element14; ComponentLink1Description: https://datasheet.ciiva.com/7983/1018594-7983519.pdf?src-supplier=Element14; ComponentLink2URL: https://datasheet.ciiva.com/46394/1018594-46394936.pdf?src-supplier=Element14; ComponentLink2Description: https://datasheet.ciiva.com/46394/1018594-46394936.pdf?src-supplier=Element14; ComponentLink3URL: https://datasheet.ciiva.com/2453/pyu-r-int-thick-7-2453401.pdf?src-supplier=Digi-Key; ComponentLink3Description: https://datasheet.ciiva.com/2453/pyu-r-int-thick-7-2453401.pdf?src-supplier=Digi-Key; ComponentLink4URL: https://datasheet.ciiva.com/2453/pyu-r-int-thick-7-2453402.pdf?src-supplier=Digi-Key; ComponentLink4Description: https://datasheet.ciiva.com/2453/pyu-r-int-thick-7-2453402.pdf?src-supplier=Digi-Key; ComponentLink5URL: https://datasheet.ciiva.com/2453/pyu-r-int-thick-7-2453400.pdf?src-supplier=Digi-Key; ComponentLink5Description: https://datasheet.ciiva.com/2453/pyu-r-int-thick-7-2453400.pdf?src-supplier=Digi-Key; ComponentLink6URL: https://datasheet.ciiva.com/12558/pyu-rc0402-51-rohs-l-6-r-8721-12558460.pdf?src-supplier=Mouser; ComponentLink6Description: https://datasheet.ciiva.com/12558/pyu-rc0402-51-rohs-l-6-r-8721-12558460.pdf?src-supplier=Mouser; ComponentLink7URL: https://datasheet.ciiva.com/16744/pyu-rc0402-51-rohs-l-6-r-16744283.pdf?src-supplier=Future+Electronics; ComponentLink7Description: https://datasheet.ciiva.com/16744/pyu-rc0402-51-rohs-l-6-r-16744283.pdf?src-supplier=Future+Electronics; ComponentLink8URL: https://datasheet.ciiva.com/15189/getdatasheetpartid-323636-15189493.pdf?src-supplier=Verical; ComponentLink8Description: https://datasheet.ciiva.com/15189/getdatasheetpartid-323636-15189493.pdf?src-supplier=Verical; Supplier Part Number 1: RC0402FR-075K1L; LCSC Part Number: C105872
R113 = RC0402FR-070RL: RES 0 OHM JUMPER 1/16W 0402; Manufacturer: Yageo; Item Type: Resistors; Resistance: 0R; Tolerance: 1%; Power Rating: 62.5mW; Voltage Rating: 50V; Temperature Coefficient: 200ppm/°C; Max Power Dissipation: 63mW; Supplier 1: Mouser; Manufacturer Part Number: RC0402FR-070RL; RoHS: Yes; Stock 1: 8556842; Pricing 1: 1=0.10000, 10=0.01400, 50=0.01400, 100=0.00600, 1000=0.00300, 5000=0.00200, 10000=0.00100 (USD); Mount: Surface Mount; Case/Package: 0402; Contact Plating: Tin,Matte; Case Code (Imperial): 0402; Case Code (Metric): 1005; Size Code: 0402; Min Operating Temperature: -55°C; Max Operating Temperature: 155°C; Resistor Type: Thick Film; Packaging: Tape and Reel; Termination: SMD/SMT; Features: Moisture Resistant; Series: RC; Number of Terminations: 2; Length: 1mm; Width: 0.5mm; Height: 0.35mm; Radiation Hardening: No; Lead Free: Lead Free; RoHS Compliant: Yes; ComponentLink1URL: https://datasheet.ciiva.com/8896/pyu-rc0402-51-rohs-l-6-8896149.pdf?src-supplier=Avnet; ComponentLink1Description: https://datasheet.ciiva.com/8896/pyu-rc0402-51-rohs-l-6-8896149.pdf?src-supplier=Avnet; ComponentLink2URL: https://datasheet.ciiva.com/16790/pyu-rc0402-51-rohs-l-6-r-16790444.pdf?src-supplier=Future+Electronics; ComponentLink2Description: https://datasheet.ciiva.com/16790/pyu-rc0402-51-rohs-l-6-r-16790444.pdf?src-supplier=Future+Electronics; Supplier Part Number 1: 603-RC0402FR-070RL; LCSC Part Number: C106231
SW4 = B3U-1000P: SWITCH TACTILE SPST-NO 0.05A 12V; Manufacturer: Omron; Mechanical Life: 200000Cycles; Operating Force: 1.5N; Throw Configuration: SPST; Current Rating: 50mA; Contact Resistance: 100mR; Illumination Type: Non-Illuminated,Illuminated; Switch Travel: 0.15mm; Switch Function: Off-Mom; Actuator Type: Standard; Actuator Length: 0.4mm; Ratings: Dust Proof,IP40; ComponentLink1URL: http://www.farnell.com/datasheets/60838.pdf?src-supplier=Farnell; ComponentLink1Description: http://www.farnell.com/datasheets/60838.pdf?src-supplier=Farnell; ComponentLink2URL: http://www.farnell.com/datasheets/60838.pdf?src-supplier=Element14; ComponentLink2Description: http://www.farnell.com/datasheets/60838.pdf?src-supplier=Element14; ComponentLink3URL: https://omronfs.omron.com/en_US/ecb/products/pdf/en-b3u.pdf?src-supplier=Digi-Key; ComponentLink3Description: https://omronfs.omron.com/en_US/ecb/products/pdf/en-b3u.pdf?src-supplier=Digi-Key; ComponentLink4URL: http://www.omron.com/ecb/products/pdf/en-b3u.pdf?src-supplier=Digi-Key; ComponentLink4Description: http://www.omron.com/ecb/products/pdf/en-b3u.pdf?src-supplier=Digi-Key; ComponentLink5URL: https://www.distrelec.biz/Web/Downloads/he/et/B3U_eng_datasheet.pdf?mime=application%2Fpdf&src-supplier=Distrelec; ComponentLink5Description: https://www.distrelec.biz/Web/Downloads/he/et/B3U_eng_datasheet.pdf?mime=application%2Fpdf&src-supplier=Distrelec; ComponentLink6URL: http://www.onlinecomponents.com/productFiles/mf-OM/en-b3u.pdf?src-supplier=Onlinecomponents.com; ComponentLink6Description: http://www.onlinecomponents.com/productFiles/mf-OM/en-b3u.pdf?src-supplier=Onlinecomponents.com; Supplier 1: Digi-Key; Manufacturer Part Number: B3U-1000P; Stock 1: 116454; Pricing 1: 1=1, 10=0.961, 25=0.9064, 50=0.7976, 100=0.7251, 250=0.68888, 500=0.67074, 1000=0.52571 (USD); Mount: Surface Mount; Weight: 0.000776oz; Contact Material: Silver; Min Operating Temperature: -25°C; Max Operating Temperature: 70°C; Packaging: Tape and Reel; Voltage Rating (DC): 12V; Package Quantity: 1; Max Current Rating: 50mA; Termination: SMD/SMT; Orientation: Straight; Max Voltage Rating (DC): 12V; Electrical Life: 200000Cycles; Insulation Resistance: 100MR; Contact Current Rating: 50mA; Length: 4mm; Height: 1.2mm; Depth: 2.5mm; Width: 3mm; REACH SVHC: Unknown; Lead Free: Lead Free; ComponentLink7URL: https://www.verical.com/server-webapp/html/getDatasheet?partID=552554&src-supplier=Verical; ComponentLink7Description: https://www.verical.com/server-webapp/html/getDatasheet?partID=552554&src-supplier=Verical; ComponentLink8URL: http://www.farnell.com/datasheets/1685550.pdf?src-supplier=Element14; ComponentLink8Description: http://www.farnell.com/datasheets/1685550.pdf?src-supplier=Element14; ComponentLink9URL: http://www.farnell.com/datasheets/2610940.pdf?src-supplier=Farnell; ComponentLink9Description: http://www.farnell.com/datasheets/2610940.pdf?src-supplier=Farnell; ComponentLink10URL: https://www.alliedelec.com/m/d/4c8a9ef82804fc3c241a13c1e298fd73.pdf?src-supplier=Allied+Electronics; ComponentLink10Description: https://www.alliedelec.com/m/d/4c8a9ef82804fc3c241a13c1e298fd73.pdf?src-supplier=Allied+Electronics; Supplier Part Number 1: SW1020DKR-ND; LCSC Part Number: C231329; Item Type: Switch
TP7 TP8 = TEST POINT 0.5mm Dia: Test Point ON; Item Type: Test Point; Manufacturer Part Number: TEST POINT 0.5mm Dia
U14 = STM32F446VET6: IC MCU 32BIT 512KB FLASH 100LQFP; Manufacturer: STMicroelectronics; Manufacturer Part Number: STM32F446VET6; Package: LQFP (14x14); LCSC Part Number: C91929; Item Type: IC
X4 = 5TJ480000XYLBC: 8MHz 18pF ±10ppm SMD5032-4P Crystals ROHS; Manufacturer: JYJE; Manufacturer Part Number: 5TJ480000XYLBC; ComponentLink1Description: LCSC; ComponentLink1URL: https://www.lcsc.com/product-detail/Crystals_JYJE-5TJ480000XYLBC_C2149247.html; Package: SMD5032-4P; LCSC Part Number: C2149247; Item Type: Crystal

## Sheet Motor_Driver_Sheet2.SchDoc
size 420 x 297 mm; SheetNumber: 14; SheetTotal: 26
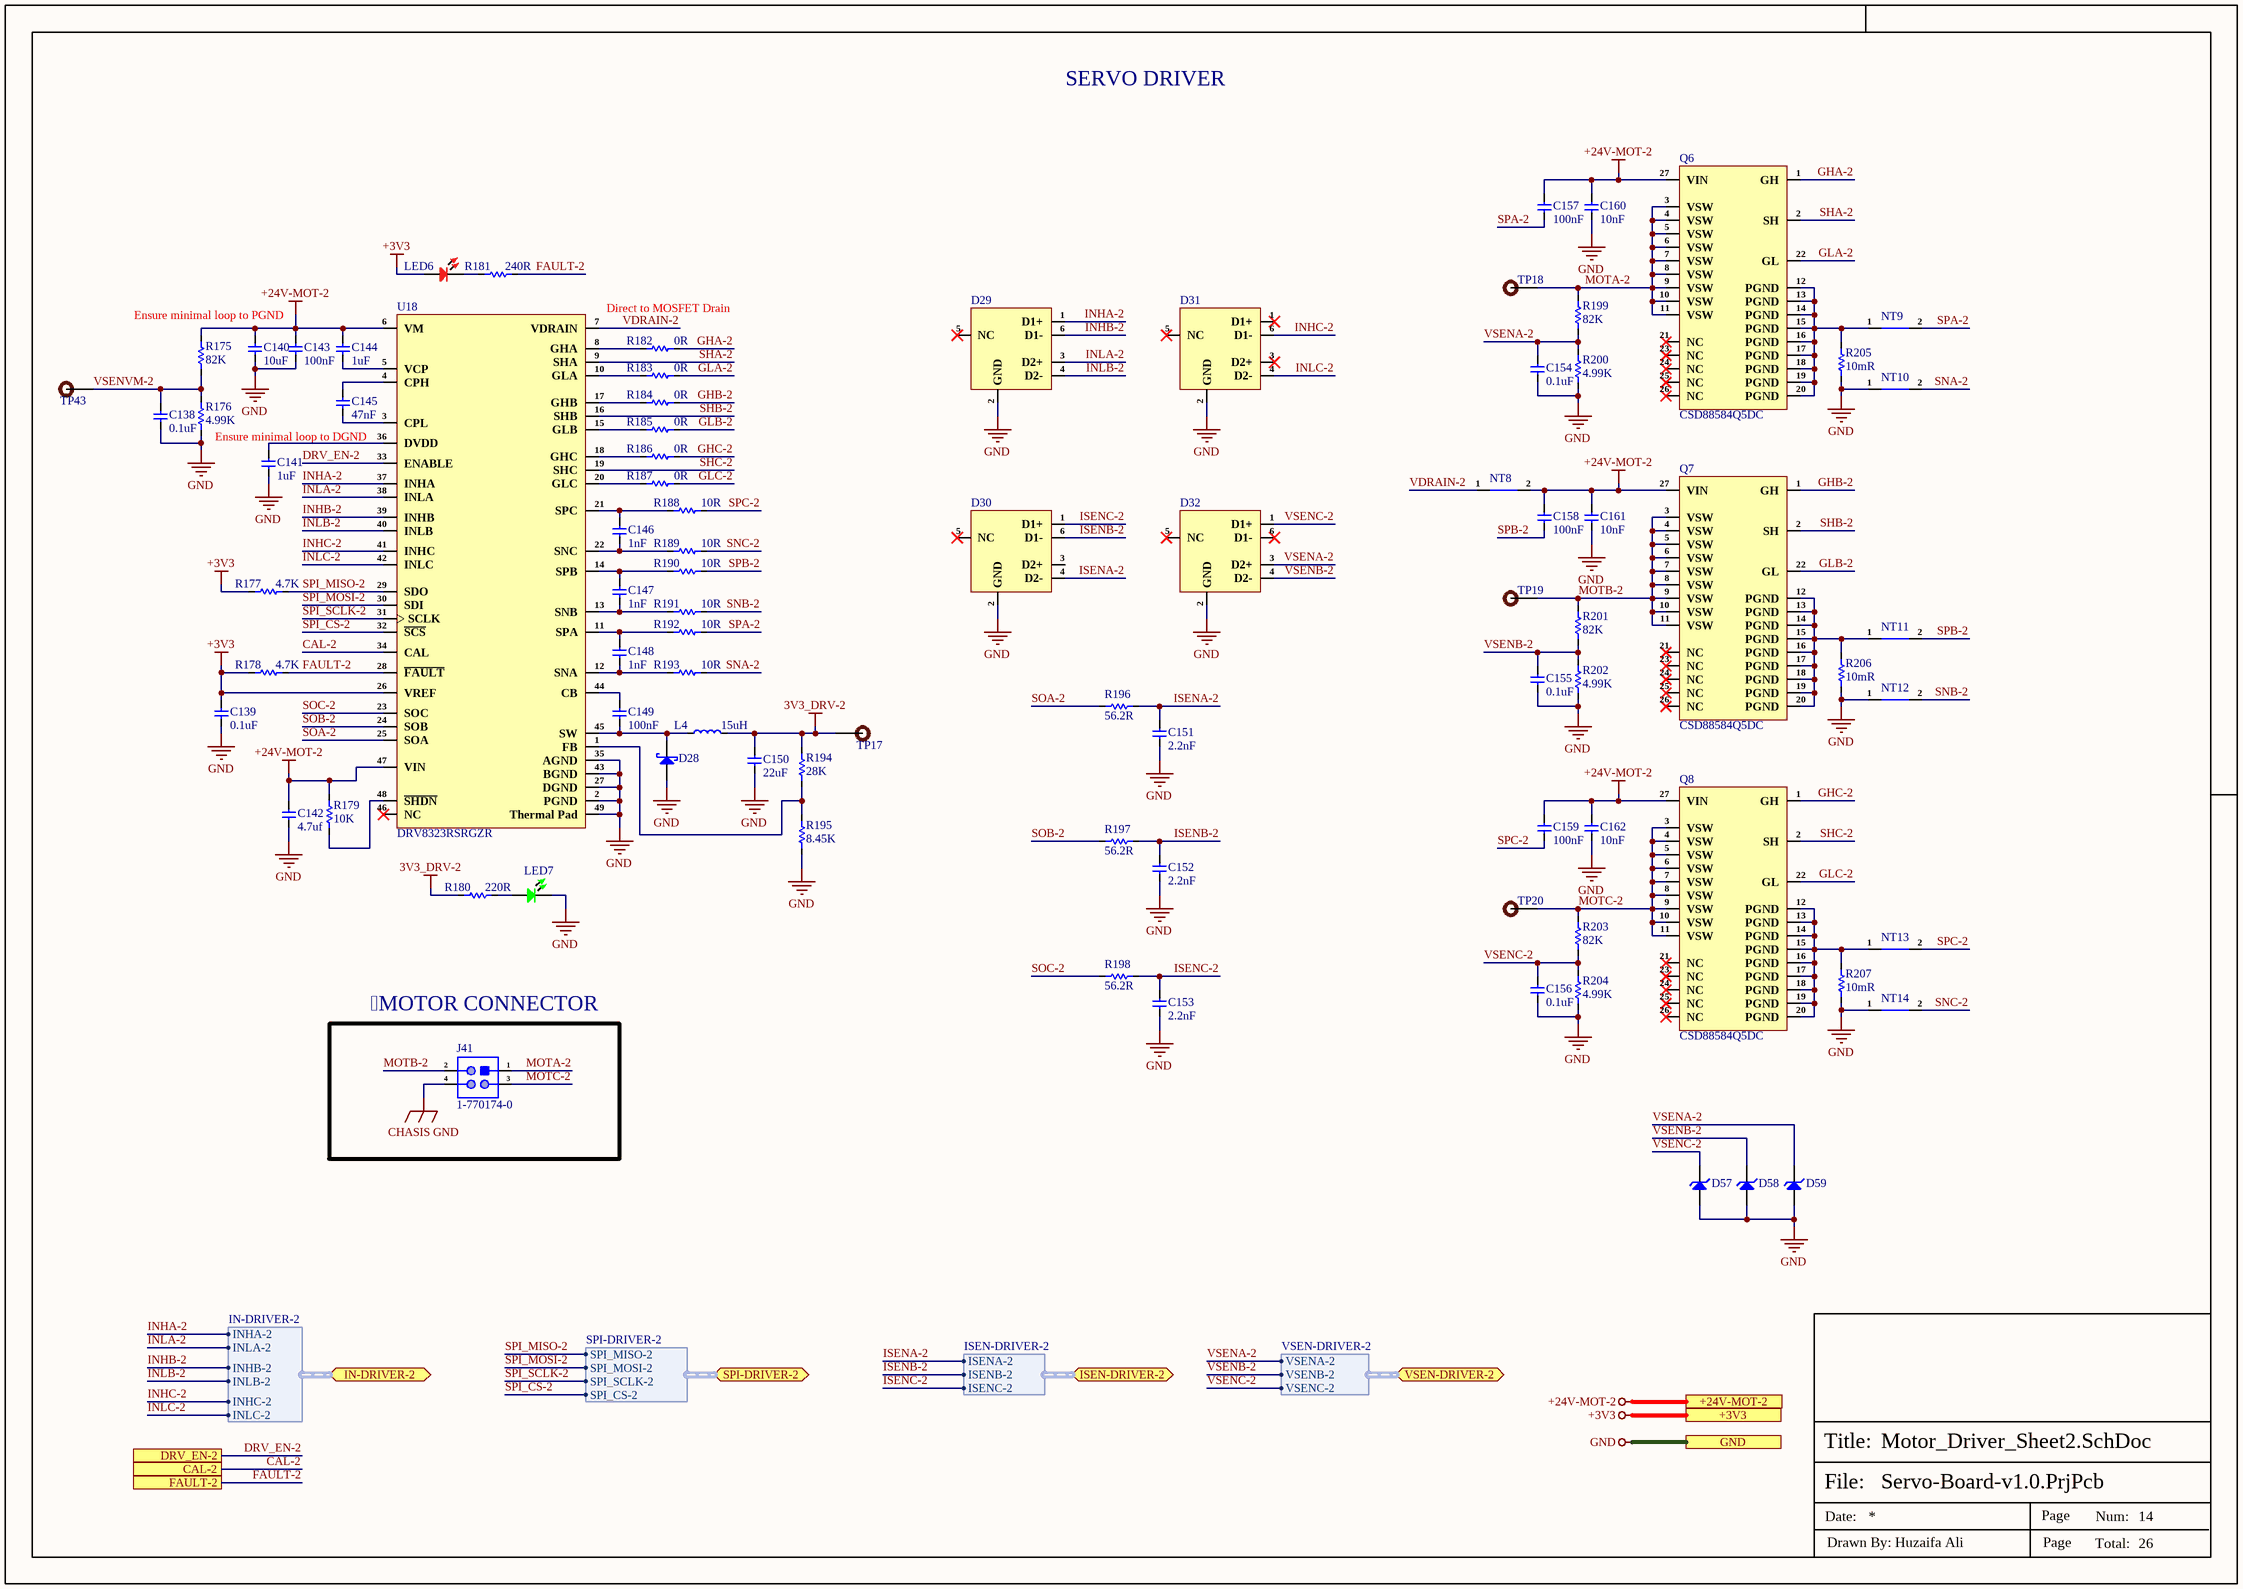
[diagram p23: Motor_Driver_Sheet2.SchDoc]

### Parts
C138  0.1uF  [Cap-0402]
C139  0.1uF  [Cap-0402]
C140  10uF  [Cap-1206]
C141  1uF  [Cap-0603]
C142  4.7uf  [Cap-0805]
C143  100nF  [Cap-0603]
C144  1uF  [Cap-0603]
C145  47nF  [Cap-0402]
C146  1nF  [Cap-0402]
C147  1nF  [Cap-0402]
C148  1nF  [Cap-0402]
C149  100nF  [Cap-0603]
C150  22uF  [Cap-0603]
C151  2.2nF  [Cap-0603]
C152  2.2nF  [Cap-0603]
C153  2.2nF  [Cap-0603]
C154  0.1uF  [Cap-0402]
C155  0.1uF  [Cap-0402]
C156  0.1uF  [Cap-0402]
C157  100nF  [Cap-0603]
C158  100nF  [Cap-0603]
C159  100nF  [Cap-0603]
C160  10nF  [Cap-0402]
C161  10nF  [Cap-0402]
C162  10nF  [Cap-0402]
D28  SS24A  [SMA]  (value not drawn)
D29  TPD4E1U06DCKR  [SOT-363]  (value not drawn)
D30  TPD4E1U06DCKR  [SOT-363]  (value not drawn)
D31  TPD4E1U06DCKR  [SOT-363]  (value not drawn)
D32  TPD4E1U06DCKR  [SOT-363]  (value not drawn)
D57  MM3Z3V3B  [SOD323F]  (value not drawn)
D58  MM3Z3V3B  [SOD323F]  (value not drawn)
D59  MM3Z3V3B  [SOD323F]  (value not drawn)
J41  1-770174-0  [1-770174-0]
L4  15uH  [FEXL0550A-150M]
LED6  RED  [LED-0603]  (value not drawn)
LED7  Emerald  [LED-0603]  (value not drawn)
NT8  Net Tie_SMD  [Net Tie Pad]  (value not drawn)  (net tie, no BOM)
NT9  Net Tie_SMD  [Net Tie Pad]  (value not drawn)  (net tie, no BOM)
NT10  Net Tie_SMD  [Net Tie Pad]  (value not drawn)  (net tie, no BOM)
NT11  Net Tie_SMD  [Net Tie Pad]  (value not drawn)  (net tie, no BOM)
NT12  Net Tie_SMD  [Net Tie Pad]  (value not drawn)  (net tie, no BOM)
NT13  Net Tie_SMD  [Net Tie Pad]  (value not drawn)  (net tie, no BOM)
NT14  Net Tie_SMD  [Net Tie Pad]  (value not drawn)  (net tie, no BOM)
Q6  CSD88584Q5DC  [22-VSON-CLIP (5x6)]
Q7  CSD88584Q5DC  [22-VSON-CLIP (5x6)]
Q8  CSD88584Q5DC  [22-VSON-CLIP (5x6)]
R175  82K  [Res-0603]
R176  4.99K  [Res-0603]
R177  4.7K  [Res-0402]
R178  4.7K  [Res-0402]
R179  10K  [Res-0402]
R180  220R  [Res-0603]
R181  240R  [Res-0402]
R182  0R  [Res-0402]
R183  0R  [Res-0402]
R184  0R  [Res-0402]
R185  0R  [Res-0402]
R186  0R  [Res-0402]
R187  0R  [Res-0402]
R188  10R  [Res-0603]
R189  10R  [Res-0603]
R190  10R  [Res-0603]
R191  10R  [Res-0603]
R192  10R  [Res-0603]
R193  10R  [Res-0603]
R194  28K  [Res-0402]
R195  8.45K  [Res-0402]
R196  56.2R  [Res-0603]
R197  56.2R  [Res-0603]
R198  56.2R  [Res-0603]
R199  82K  [Res-0603]
R200  4.99K  [Res-0603]
R201  82K  [Res-0603]
R202  4.99K  [Res-0603]
R203  82K  [Res-0603]
R204  4.99K  [Res-0603]
R205  10mR  [RES-2512]
R206  10mR  [RES-2512]
R207  10mR  [RES-2512]
TP17  TEST POINT 0.5mm Dia  [Test-point - 0.5mm]  (value not drawn)  (no BOM)
TP18  TEST POINT 0.5mm Dia  [Test-point - 0.5mm]  (value not drawn)  (no BOM)
TP19  TEST POINT 0.5mm Dia  [Test-point - 0.5mm]  (value not drawn)  (no BOM)
TP20  TEST POINT 0.5mm Dia  [Test-point - 0.5mm]  (value not drawn)  (no BOM)
TP43  TEST POINT 0.5mm Dia  [Test-point - 0.5mm]  (value not drawn)  (no BOM)
U18  DRV8323RSRGZR  [48-VQFN (7x7)]

### Ports
+3V3 (see Servo2[2A], CAN_Sheet[4D], Controller_Sheet[5D], DIO_1[5D], DIO_2[5D], DIO_3[5D], DIO_4[5D], Encoder_Sheet1[5D], Encoder_Sheet2[4D], Encoder_Sheet3[4D], Encoder_Sheet4[5D], EtherCAT_Sheet[5D], Motor_Driver_Sheet1[5D], Motor_Driver_Sheet3[5D], Motor_Driver_Sheet4[5D], Power_Sheet[5D], RS485_RS232_Sheet[5D], Sec_Controller_Sheet1[5D], Sec_Controller_Sheet2[5D], Sec_Controller_Sheet3[5D], Sec_Controller_Sheet4[5D], Servo1[5D], Servo2[5D], Servo3[5D], Servo4[5D]), +24V-MOT-2 (see Servo2[2A], Power_Sheet[5D], Servo2[5D]), CAL-2 (see Servo2[2A], Sec_Controller_Sheet2[2D]), DRV_EN-2 (see Servo2[2A], Sec_Controller_Sheet2[2D]), FAULT-2 (see Servo2[2B], Sec_Controller_Sheet2[2D]), GND (see Servo2[2A], CAN_Sheet[4D], Controller_Sheet[5D], DIO_1[5D], DIO_2[5D], DIO_3[5D], DIO_4[5D], Encoder_Sheet1[5D], Encoder_Sheet2[4D], Encoder_Sheet3[4D], Encoder_Sheet4[5D], EtherCAT_Sheet[5D], Motor_Driver_Sheet1[5D], Motor_Driver_Sheet3[5D], Motor_Driver_Sheet4[5D], Power_Sheet[5D], RS485_RS232_Sheet[5D], Sec_Controller_Sheet1[5D], Sec_Controller_Sheet2[5D], Sec_Controller_Sheet3[5D], Sec_Controller_Sheet4[5D], Servo1[5D], Servo2[5D], Servo3[5D], Servo4[5D]), IN-DRIVER-2 (bidir, harness IN-DRIVER-2, see Servo2[2B], Sec_Controller_Sheet2[2D]), ISEN-DRIVER-2 (bidir, harness ISEN-DRIVER-2, see Servo2[2B], Sec_Controller_Sheet2[2D]), SPI-DRIVER-2 (bidir, harness SPI-DRIVER-2, see Servo2[2B], Sec_Controller_Sheet2[2D]), VSEN-DRIVER-2 (bidir, harness VSEN-DRIVER-2, see Servo2[2B], Sec_Controller_Sheet2[3C])

### Harnesses
IN-DRIVER-2: INHA-2, INLA-2, INHB-2, INLB-2, INHC-2, INLC-2
SPI-DRIVER-2: SPI_MISO-2, SPI_MOSI-2, SPI_SCLK-2, SPI_CS-2
ISEN-DRIVER-2: ISENA-2, ISENB-2, ISENC-2
VSEN-DRIVER-2: VSENA-2, VSENB-2, VSENC-2

### Nets
3V3_DRV-2: C150.2 L4.2 R180.1 R194.2 TP17.1
+3V3: C139.2 LED6.1 R177.1 R178.1 U18.26(VREF) ; port +3V3
+24V-MOT-2: C140.2 C142.2 C143.2 C144.2 C157.2 C158.2 C159.2 C160.2 C161.2 C162.2 NT8.2 Q6.27(VIN) Q7.27(VIN) Q8.27(VIN) R175.2 R179.1 U18.6(VM) U18.47(VIN) ; port +24V-MOT-2
CHASIS GND: J41.4
GND: C138.1 C139.1 C140.1 C141.1 C142.1 C143.1 C150.1 C151.1 C152.1 C153.1 C154.1 C155.1 C156.1 C160.1 C161.1 C162.1 D28.2(A) D29.2(GND) D30.2(GND) D31.2(GND) D32.2(GND) D57.1(A) D58.1(A) D59.1(A) LED7.2 NT10.1 NT12.1 NT14.1 R176.1 R195.1 R200.1 R202.1 R204.1 R205.1 R206.1 R207.1 U18.2(PGND) U18.27(DGND) U18.35(AGND) U18.43(BGND) U18.49(Thermal_Pad) ; port GND
CAL-2: U18.34(CAL) ; port CAL-2
DRV_EN-2: U18.33(ENABLE) ; port DRV_EN-2
FAULT-2: R178.2 R181.2 U18.28(~{FAULT}) ; port FAULT-2
GHA-2: Q6.1(GH) R182.2
GHB-2: Q7.1(GH) R184.2
GHC-2: Q8.1(GH) R186.2
GLA-2: Q6.22(GL) R183.2
GLB-2: Q7.22(GL) R185.2
GLC-2: Q8.22(GL) R187.2
INHA-2: D29.1(D1+) U18.37(INHA) ; port IN-DRIVER-2.INHA-2
INHB-2: D29.6(D1-) U18.39(INHB) ; port IN-DRIVER-2.INHB-2
INHC-2: D31.6(D1-) U18.41(INHC) ; port IN-DRIVER-2.INHC-2
INLA-2: D29.3(D2+) U18.38(INLA) ; port IN-DRIVER-2.INLA-2
INLB-2: D29.4(D2-) U18.40(INLB) ; port IN-DRIVER-2.INLB-2
INLC-2: D31.4(D2-) U18.42(INLC) ; port IN-DRIVER-2.INLC-2
ISENA-2: C151.2 D30.4(D2-) R196.2 ; port ISEN-DRIVER-2.ISENA-2
ISENB-2: C152.2 D30.6(D1-) R197.2 ; port ISEN-DRIVER-2.ISENB-2
ISENC-2: C153.2 D30.1(D1+) R198.2 ; port ISEN-DRIVER-2.ISENC-2
MOTA-2: J41.1 Q6.3(VSW) Q6.4(VSW) Q6.5(VSW) Q6.6(VSW) Q6.7(VSW) Q6.8(VSW) Q6.9(VSW) Q6.10(VSW) Q6.11(VSW) R199.2 TP18.1
MOTB-2: J41.2 Q7.3(VSW) Q7.4(VSW) Q7.5(VSW) Q7.6(VSW) Q7.7(VSW) Q7.8(VSW) Q7.9(VSW) Q7.10(VSW) Q7.11(VSW) R201.2 TP19.1
MOTC-2: J41.3 Q8.3(VSW) Q8.4(VSW) Q8.5(VSW) Q8.6(VSW) Q8.7(VSW) Q8.8(VSW) Q8.9(VSW) Q8.10(VSW) Q8.11(VSW) R203.2 TP20.1
SHA-2: Q6.2(SH) U18.9(SHA)
SHB-2: Q7.2(SH) U18.16(SHB)
SHC-2: Q8.2(SH) U18.19(SHC)
SNA-2: NT10.2 R193.2
SNB-2: NT12.2 R191.2
SNC-2: NT14.2 R189.2
SOA-2: R196.1 U18.25(SOA)
SOB-2: R197.1 U18.24(SOB)
SOC-2: R198.1 U18.23(SOC)
SPA-2: C157.1 NT9.2 R192.2
SPB-2: C158.1 NT11.2 R190.2
SPC-2: C159.1 NT13.2 R188.2
SPI_CS-2: U18.32(~{SCS}) ; port SPI-DRIVER-2.SPI_CS-2
SPI_MISO-2: R177.2 U18.29(SDO) ; port SPI-DRIVER-2.SPI_MISO-2
SPI_MOSI-2: U18.30(SDI) ; port SPI-DRIVER-2.SPI_MOSI-2
SPI_SCLK-2: U18.31(SCLK) ; port SPI-DRIVER-2.SPI_SCLK-2
VDRAIN-2: NT8.1 U18.7(VDRAIN)
VSENA-2: C154.2 D32.3(D2+) D59.2(K) R199.1 R200.2 ; port VSEN-DRIVER-2.VSENA-2
VSENB-2: C155.2 D32.4(D2-) D58.2(K) R201.1 R202.2 ; port VSEN-DRIVER-2.VSENB-2
VSENC-2: C156.2 D32.1(D1+) D57.2(K) R203.1 R204.2 ; port VSEN-DRIVER-2.VSENC-2
VSENVM-2: C138.2 R175.1 R176.2 TP43.1
NetC141_2: C141.2 U18.36(DVDD)
NetC144_1: C144.1 U18.5(VCP)
NetC145_1: C145.1 U18.3(CPL)
NetC145_2: C145.2 U18.4(CPH)
NetC146_1: C146.1 R189.1 U18.22(SNC)
NetC146_2: C146.2 R188.1 U18.21(SPC)
NetC147_1: C147.1 R191.1 U18.13(SNB)
NetC147_2: C147.2 R190.1 U18.14(SPB)
NetC148_1: C148.1 R193.1 U18.12(SNA)
NetC148_2: C148.2 R192.1 U18.11(SPA)
NetC149_1: C149.1 D28.1(K) L4.1 U18.45(SW)
NetC149_2: C149.2 U18.44(CB)
NetLED6_2: LED6.2 R181.1
NetLED7_1: LED7.1 R180.2
NetNT9_1: NT9.1 Q6.12(PGND) Q6.13(PGND) Q6.14(PGND) Q6.15(PGND) Q6.16(PGND) Q6.17(PGND) Q6.18(PGND) Q6.19(PGND) Q6.20(PGND) R205.2
NetNT11_1: NT11.1 Q7.12(PGND) Q7.13(PGND) Q7.14(PGND) Q7.15(PGND) Q7.16(PGND) Q7.17(PGND) Q7.18(PGND) Q7.19(PGND) Q7.20(PGND) R206.2
NetNT13_1: NT13.1 Q8.12(PGND) Q8.13(PGND) Q8.14(PGND) Q8.15(PGND) Q8.16(PGND) Q8.17(PGND) Q8.18(PGND) Q8.19(PGND) Q8.20(PGND) R207.2
NetR179_2: R179.2 U18.48(~{SHDN})
NetR182_1: R182.1 U18.8(GHA)
NetR183_1: R183.1 U18.10(GLA)
NetR184_1: R184.1 U18.17(GHB)
NetR185_1: R185.1 U18.15(GLB)
NetR186_1: R186.1 U18.18(GHC)
NetR187_1: R187.1 U18.20(GLC)
NetR194_1: R194.1 R195.2 U18.1(FB)

Not connected (* = marked no-connect by the designer): D29 5(NC)*; D30 3(D2+) 5(NC)*; D31 1(D1+)* 3(D2+)* 5(NC)*; D32 5(NC)* 6(D1-)*; Q6 21(NC)* 23(NC)* 24(NC)* 25(NC)* 26(NC)*; Q7 21(NC)* 23(NC)* 24(NC)* 25(NC)* 26(NC)*; Q8 21(NC)* 23(NC)* 24(NC)* 25(NC)* 26(NC)*; U18 46(NC)*

### Notes on the sheet
- SERVO DRIVER
- Ensure minimal loop to PGND
- Direct to MOSFET Drain
- Ensure minimal loop to DGND
- MOTOR CONNECTOR
- File:
- Title:
- Date:
- Page
- Num:
- Total:
- Drawn By: Huzaifa Ali